# EAGLE design MODULE_TEST_usbHub_V_1_1_1sch (EAGLE 9.6.2)
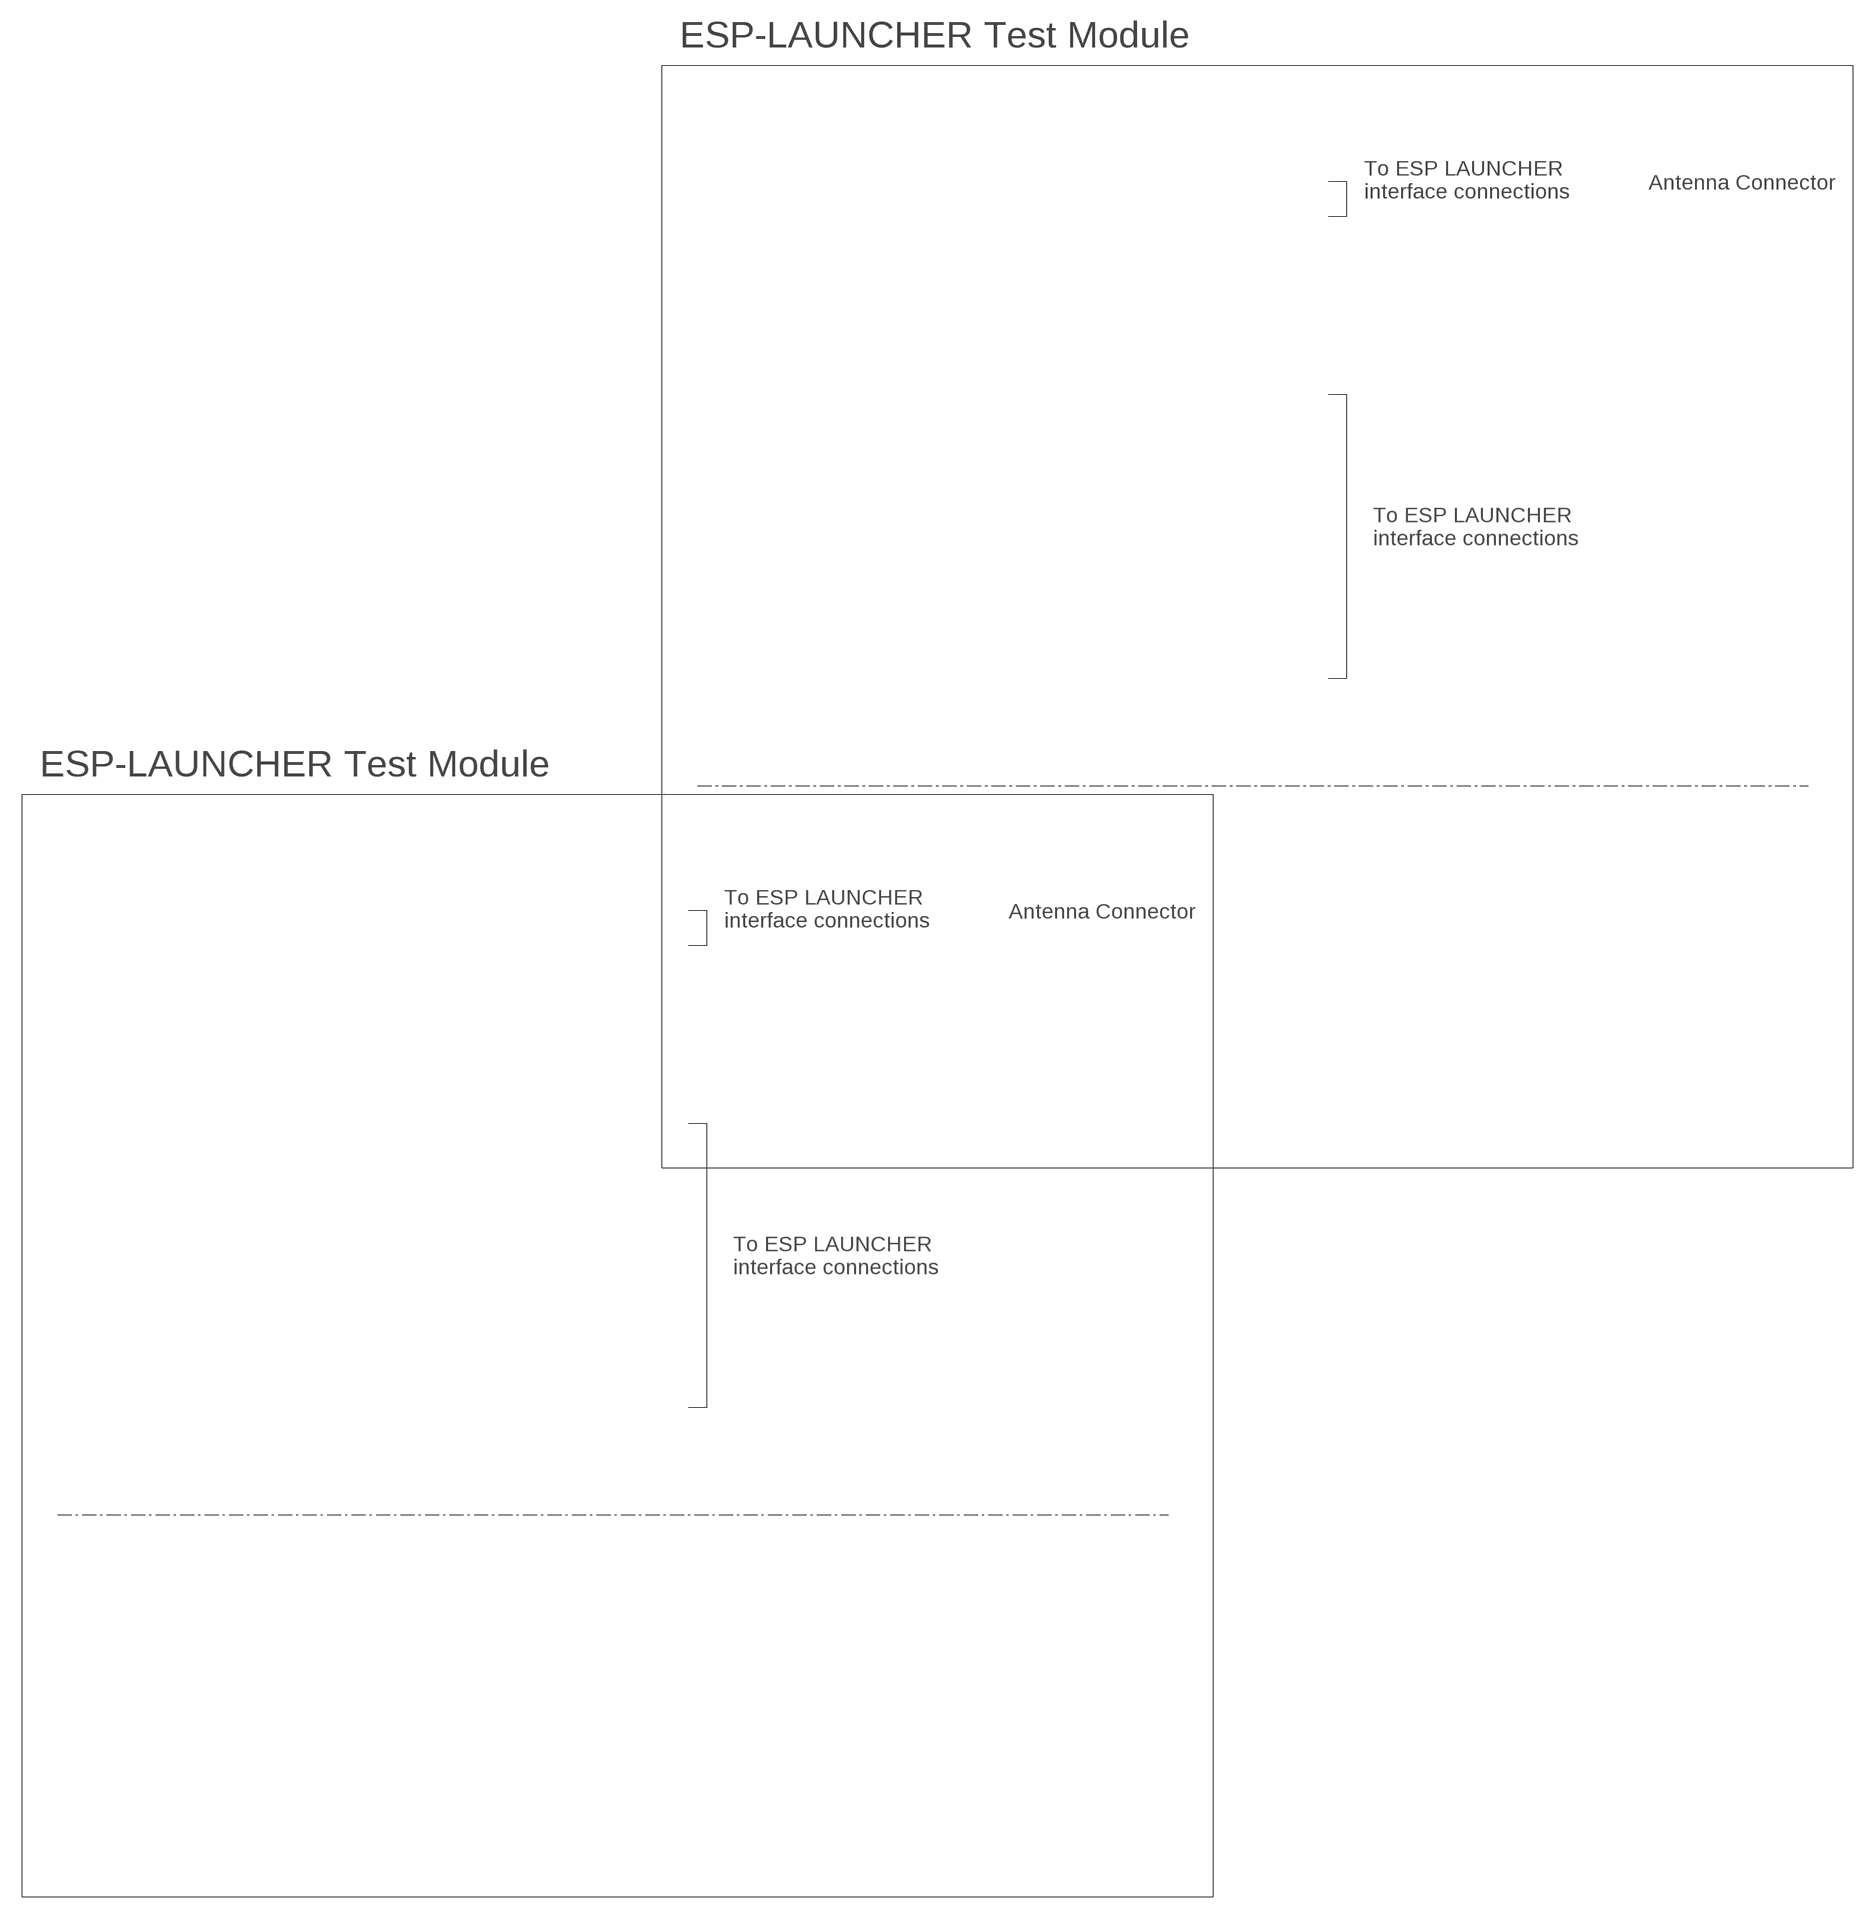
[diagram p0: schematic, sheet 1, part 1 of 3]
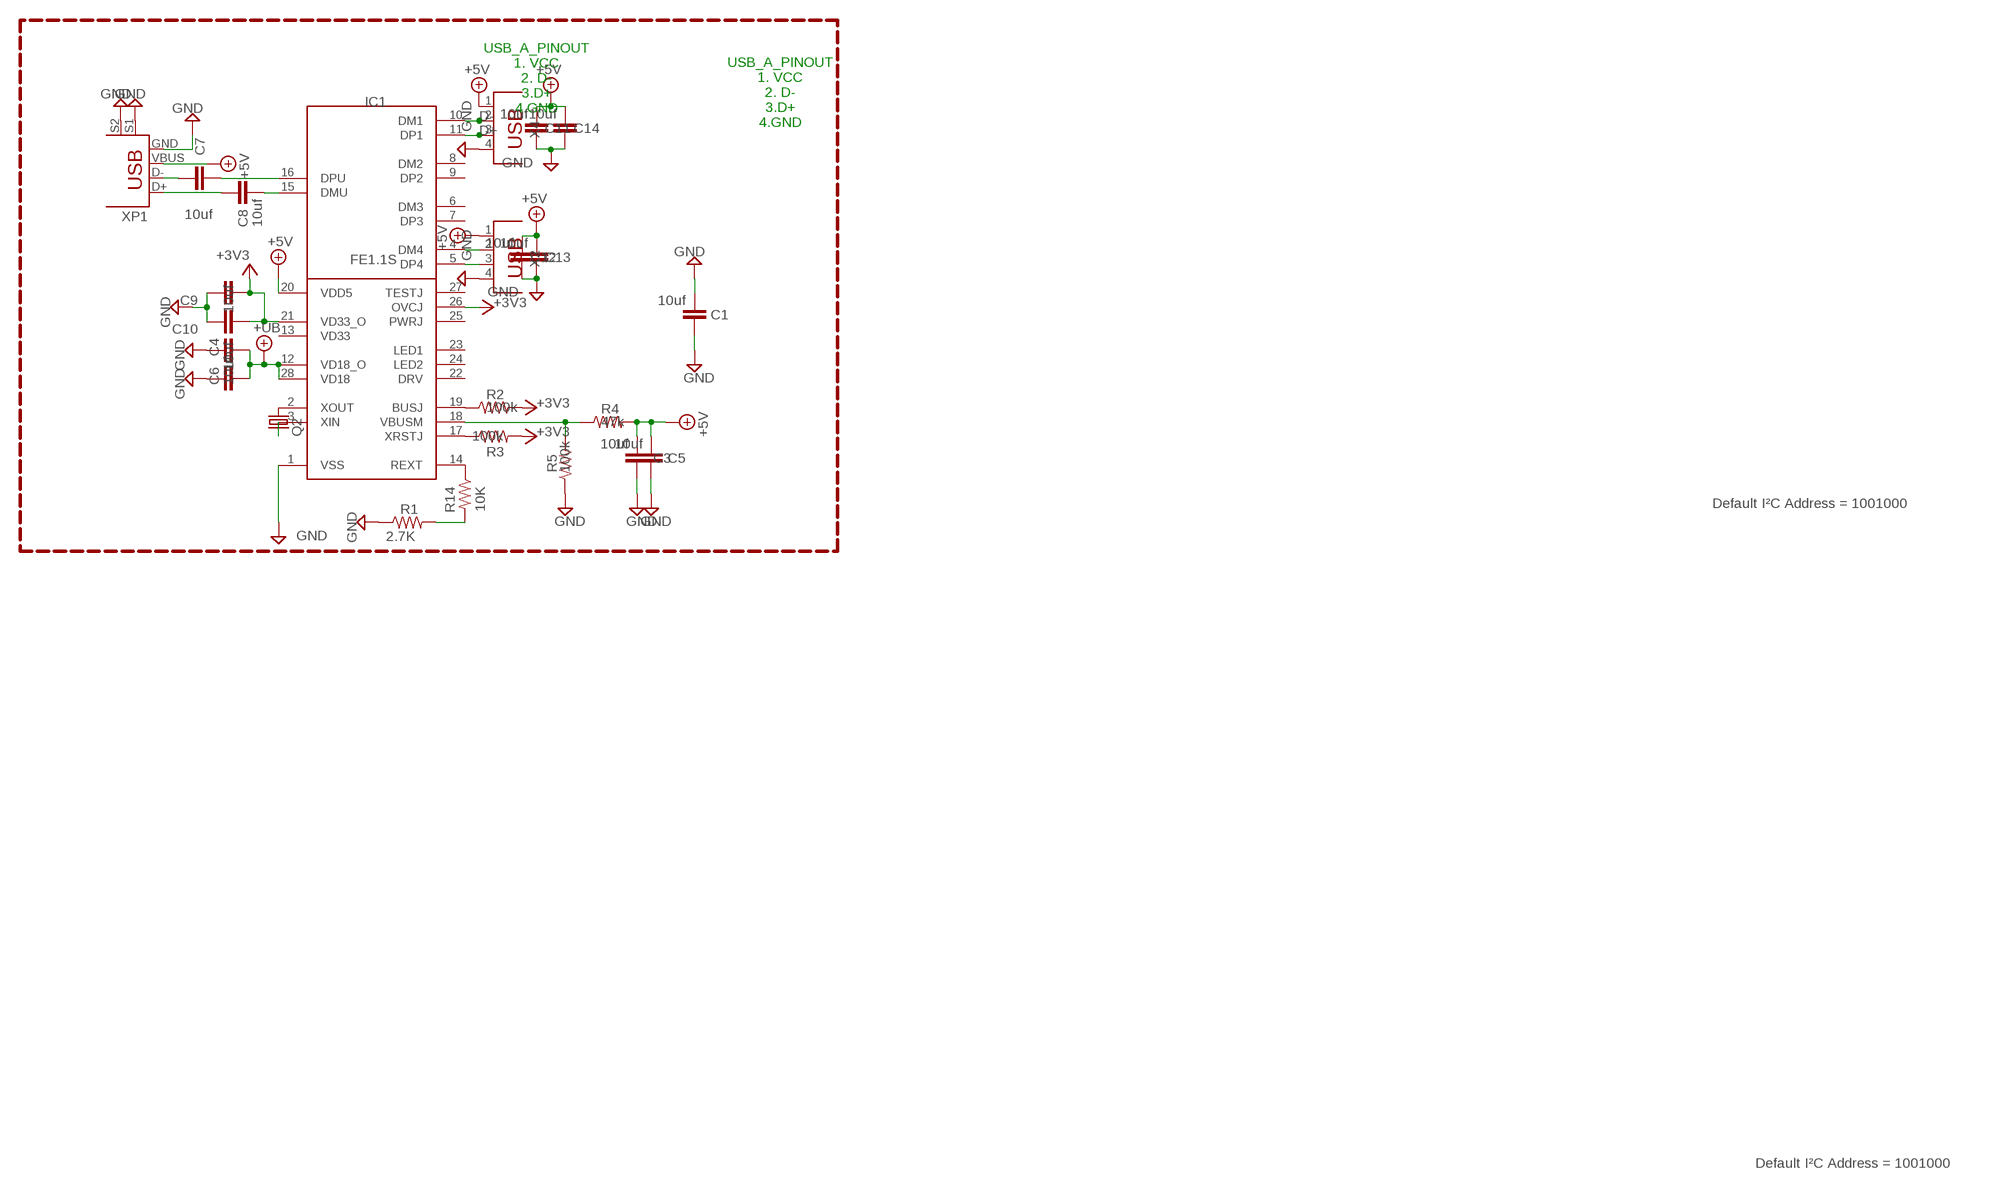
[diagram p1: schematic, sheet 1, part 2 of 3]
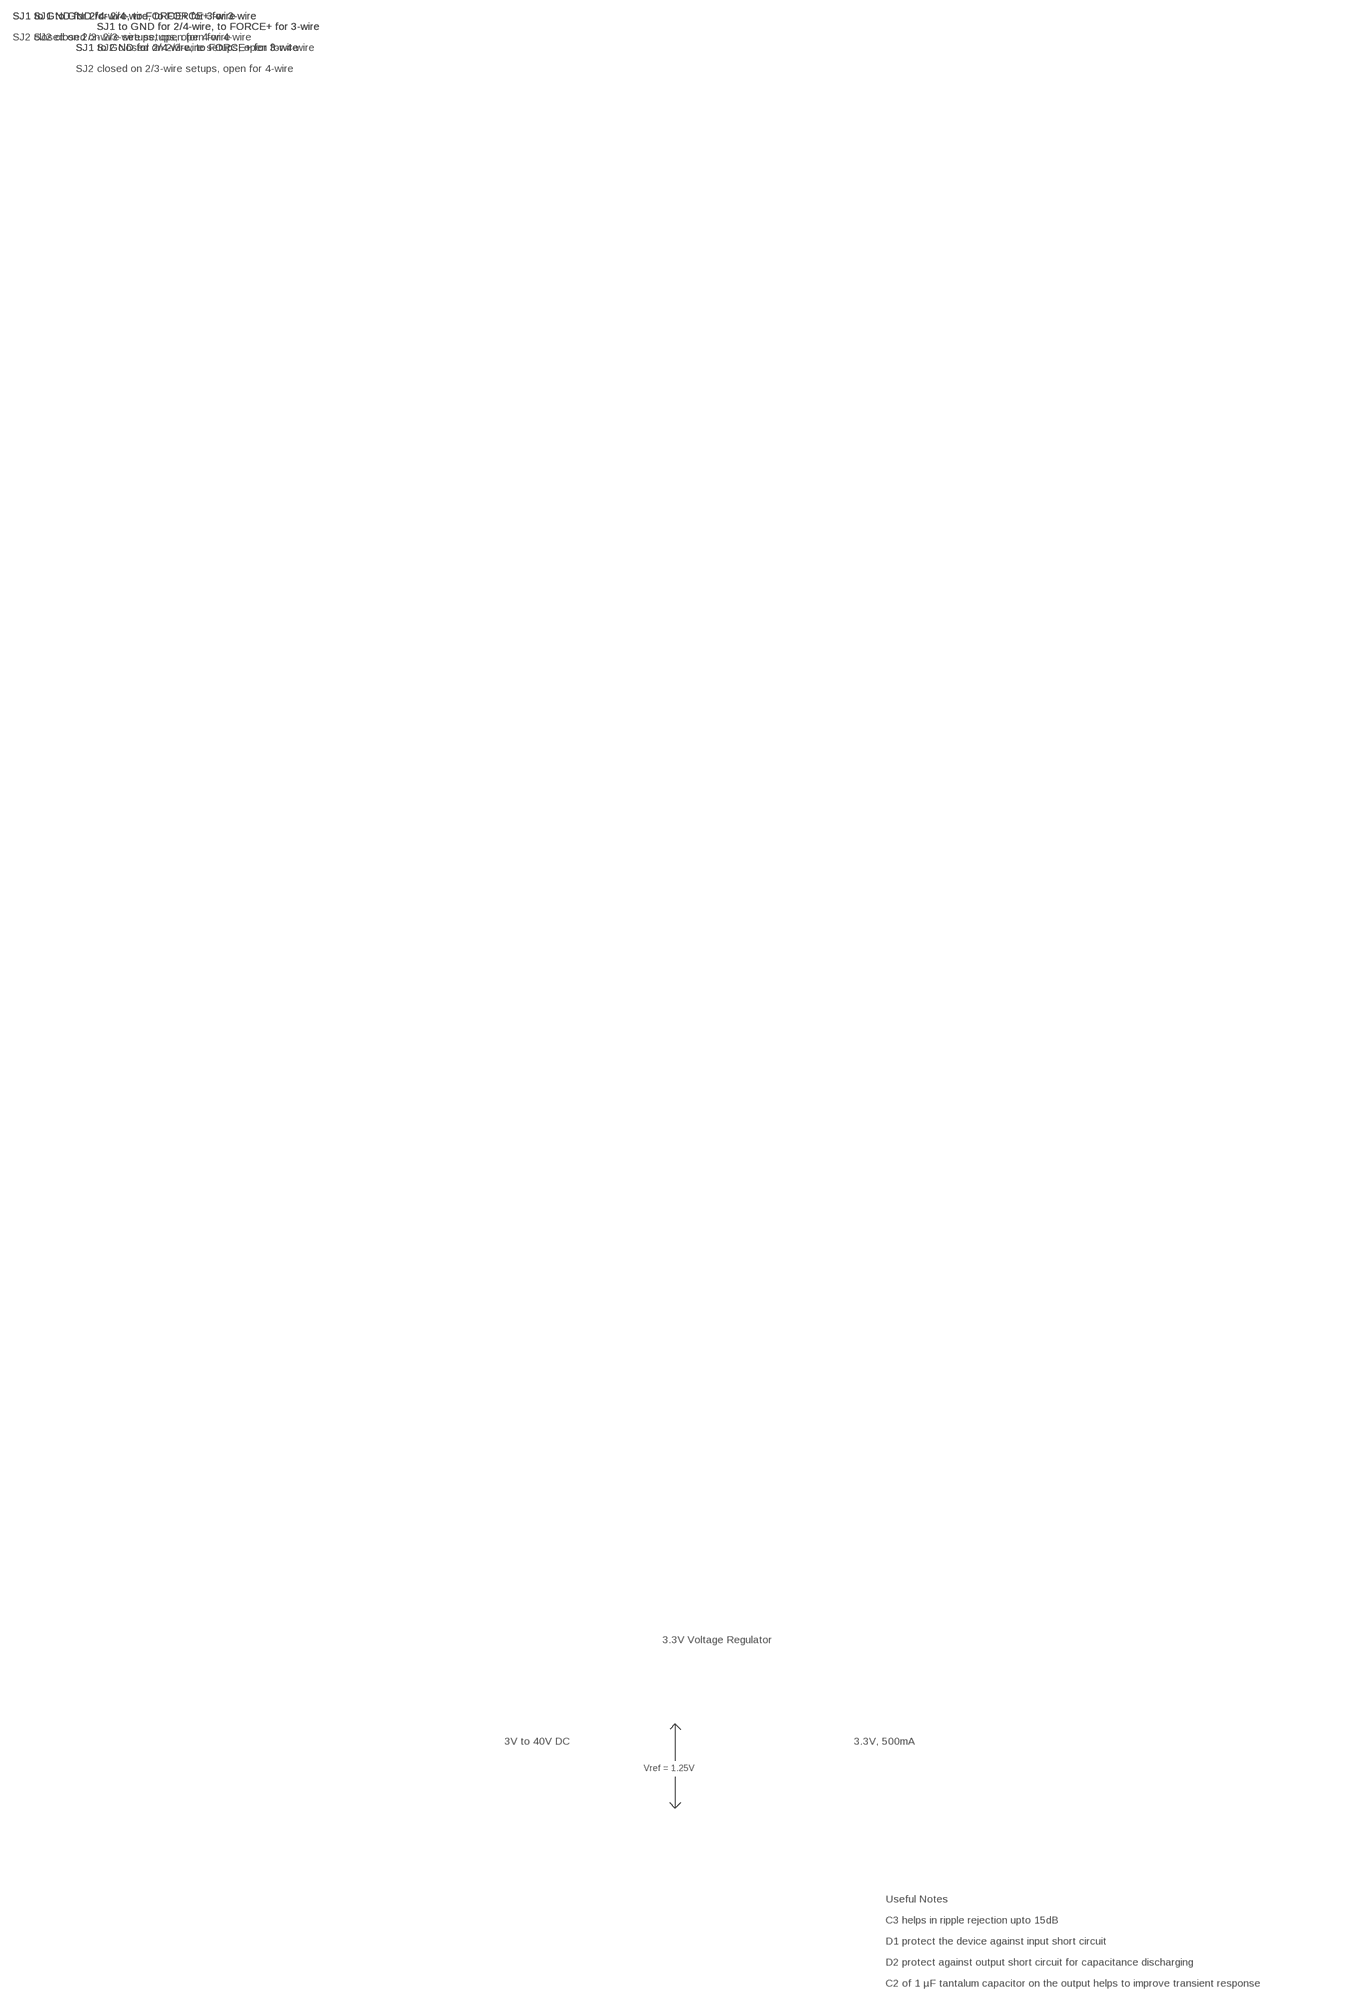
[diagram p2: schematic, sheet 1, part 3 of 3]

## Parts
C1  10uf  C-EUC1206K  [C1206K]
C3  10uf  C-EUC1206K  [C1206K]
C4  10uf  C-EUC0603  [C0603]
C5  10uf  C-EUC1206K  [C1206K]
C6  10uf  C-EUC0603  [C0603]
C7  10uf  C-EUC1206K  [C1206K]
C8  10uf  C-EUC1206K  [C1206K]
C9  10uf  C-EUC0603  [C0603]
C10  10uf  C-EUC0603  [C0603]
C11  10uf  C-EUC1206K  [C1206K]
C12  10uf  C-EUC1206K  [C1206K]
C13  10uf  C-EUC1206K  [C1206K]
C14  10uf  C-EUC1206K  [C1206K]
IC1  FE1.1S  [SOP64P600X175-28N]
Q2  CRYSTALSM49  [SM49]
R1  2.7K  R-US_R0603  [R0603]
R2  100k  R-US_R0603  [R0603]
R3  100k  R-US_R0603  [R0603]
R4  47k  R-US_R0603  [R0603]
R5  100k  R-US_R0603  [R0603]
R14  10K  R-US_R0603  [R0603]
X2  PN87520  [PN87520]
X4  PN87520  [PN87520]
XP1  USB+SHIELD  [USB-B-PTH]

## Nets
+3V3: C9.2 C10.2 IC1.21(VD33_O) IC1.26(OVCJ) R2.2 R3.2
+5V: C3.2 C5.2 C11.2 C12.2 C13.2 C14.2 IC1.20(VDD5) R4.2 X2.1 X4.1 XP1.VBUS
+UB: C4.2 C6.2 IC1.12(VD18_O) IC1.28(VD18)
D+: IC1.11(DP1) X4.3
D-: IC1.10(DM1) X4.2
GND: C1.1 C1.2 C3.1 C4.1 C5.1 C6.1 C9.1 C10.1 C11.1 C12.1 C13.1 C14.1 IC1.1(VSS) R1.1 R5.1 X2.4 X4.4 XP1.GND XP1.S1 XP1.S2
N$1: C8.1 XP1.D+
N$2: C8.2 IC1.15(DMU)
N$3: R1.2 R14.2
N$4: C7.1 XP1.D-
N$5: C7.2 IC1.16(DPU)
N$6: IC1.2(XOUT) Q2.2
N$7: IC1.19(BUSJ) R2.1
N$8: IC1.17(XRSTJ) R3.1
N$9: IC1.3(XIN) Q2.1
N$10: IC1.18(VBUSM) R4.1 R5.2
N$17: IC1.4(DM4) X2.2
N$25: IC1.14(REXT) R14.1
N$27: IC1.5(DP4) X2.3
Unconnected: IC1.6(DM3) IC1.7(DP3) IC1.8(DM2) IC1.9(DP2) IC1.13(VD33) IC1.22(DRV) IC1.23(LED1) IC1.24(LED2) IC1.25(PWRJ) IC1.27(TESTJ)

## Notes on the sheet
- ESP-LAUNCHER Test Module
- Antenna Connector
- To ESP LAUNCHER
  interface connections
- To ESP LAUNCHER
  interface connections
- ESP-LAUNCHER Test Module
- Antenna Connector
- To ESP LAUNCHER
  interface connections
- To ESP LAUNCHER
  interface connections
- USB_A_PINOUT
  1. VCC
  2. D-
  3.D+
  4.GND
- USB_A_PINOUT
  1. VCC
  2. D-
  3.D+
  4.GND
- Default I²C Address = 1001000
- Default I²C Address = 1001000
- SJ1 to GND for 2/4-wire, to FORCE+ for 3-wire | SJ1 to GND for 2/4-wire, to FORCE+ for 3-wire | SJ1 to GND for 2/4-wire, to FORCE+ for 3-wire | SJ1 to GND for 2/4-wire, to FORCE+ for 3-wire
- SJ1 to GND for 2/4-wire, to FORCE+ for 3-wire | SJ1 to GND for 2/4-wire, to FORCE+ for 3-wire
- SJ2 closed on 2/3-wire setups, open for 4-wire | SJ2 closed on 2/3-wire setups, open for 4-wire
- SJ1 to GND for 2/4-wire, to FORCE+ for 3-wire | SJ1 to GND for 2/4-wire, to FORCE+ for 3-wire | SJ2 closed on 2/3-wire setups, open for 4-wire
- SJ2 closed on 2/3-wire setups, open for 4-wire
- 3.3V Voltage Regulator
- 3V to 40V DC | 3.3V, 500mA
- Vref = 1.25V
- Useful Notes
- C3 helps in ripple rejection upto 15dB
- D1 protect the device against input short circuit
- D2 protect against output short circuit for capacitance discharging
- C2 of 1 µF tantalum capacitor on the output helps to improve transient response

## Library data of the parts
C1 C3-C14 = rcl:C-EU: CAPACITOR, European symbol; SPICEPREFIX: C
IC1 = FE1.1S:FE1.1S: Check availability <https://pricing.snapeda.com/parts/FE1.1S/terminus/view-part?ref=eda>; AVAILABILITY: In Stock; CHECK_PRICES: https://www.snapeda.com/parts/FE1.1S/Terminus/view-part/?ref=eda; DESCRIPTION: USB 2.0 HIGH SPEED 4-PORT HUB CONTROLLER; MF: terminus; MP: FE1.1S; PACKAGE: None; PRICE: None; SNAPEDA_LINK: https://www.snapeda.com/parts/FE1.1S/Terminus/view-part/?ref=snap
Q2 = adafruit:CRYSTAL: CRYSTAL; OC_FARNELL: unknown; OC_NEWARK: unknown
R1-R5 R14 = rcl:R-US_: RESISTOR, American symbol; SPICEPREFIX: R
X2 X4 = con-berg:PN87520: BERG USB connector; OC_FARNELL: unknown; OC_NEWARK: unknown
XP1 = barthess:USB+SHIELD: USB+Shield USB connector with shield pins connectable

## Module WAVESHAREDISPLAY
Ports: 

### Library data of the parts

## Board
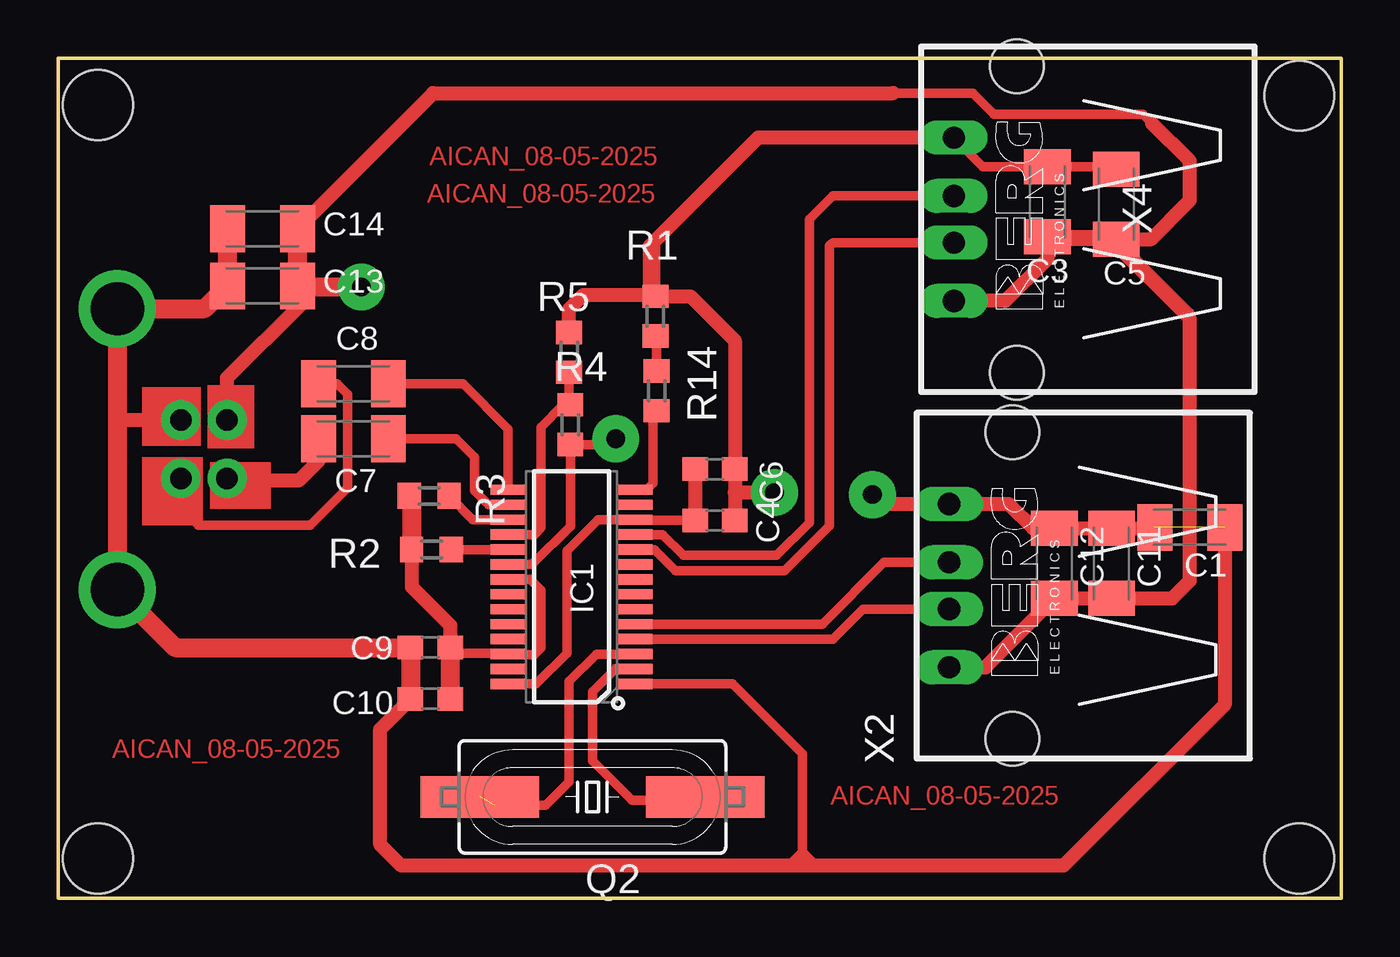
[diagram p3: board, top side]
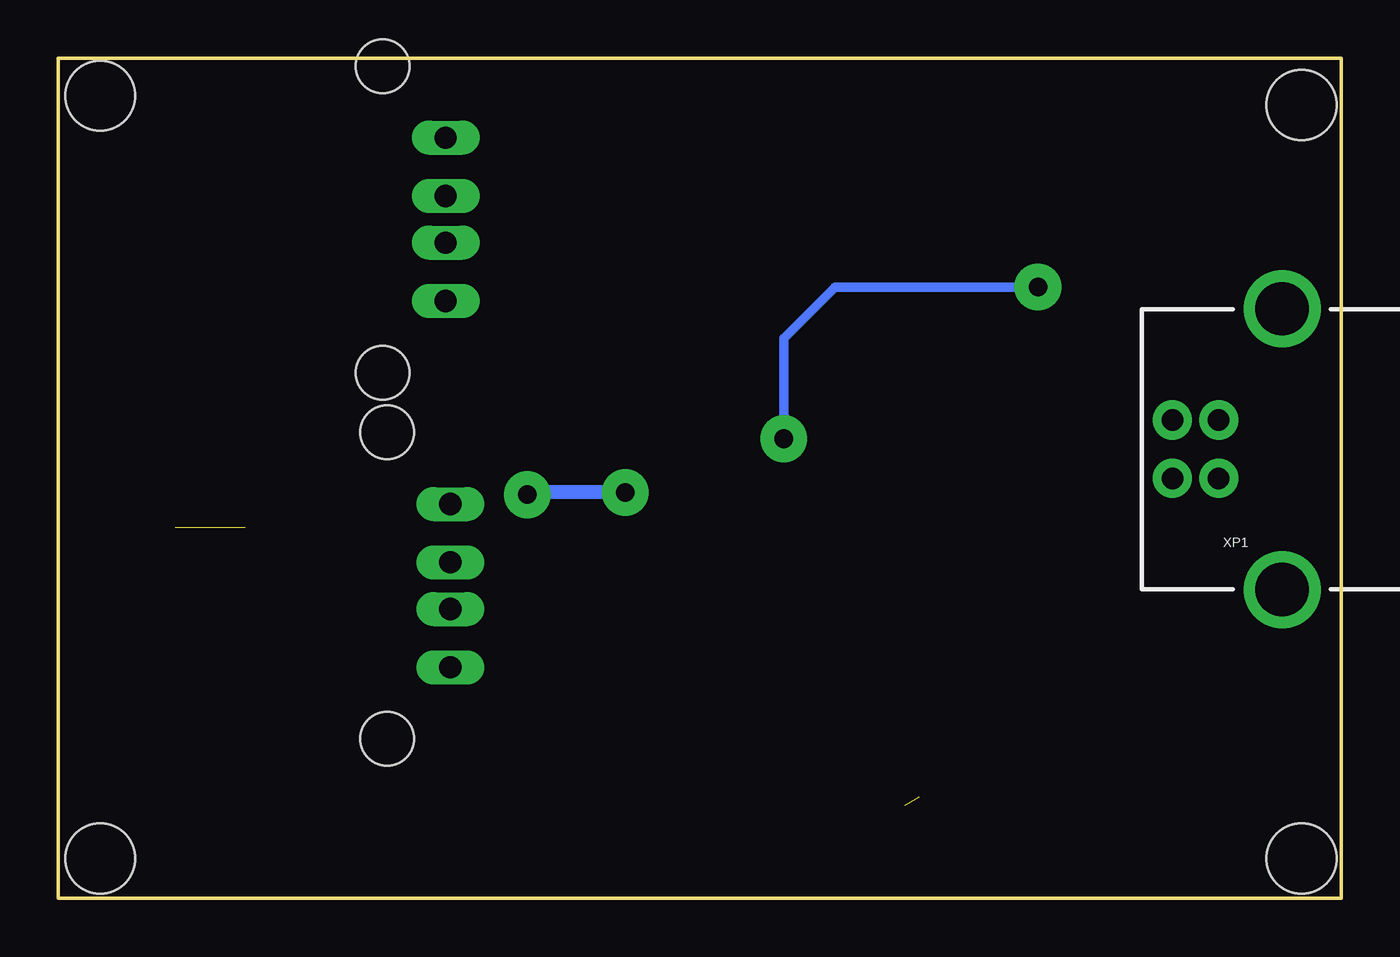
[diagram p4: board, bottom side, seen from below]

Size 55 x 36 mm. Coordinates in mm from the lower left corner, seen from the top.
Outline: 0,0 55,0 55,36 0,36 0,0
Copper layers (1*16): Top 0.035mm / dielectric 1.5mm / Bottom 0.035mm
Design rules "default": minimum track width 6mil, minimum drill 0.35mm, track to track 6mil, track to pad 6mil, pad to pad 6mil, via to via 6mil, smd to smd 6mil, copper to edge 40mil, drill to drill 6mil, minimum pad ring 10mil, minimum via ring 8mil, stop-mask expansion 4mil, vias tented up to drill 0mil, thermal gap 10mil
Holes 3 mm at 1.7,1.7 1.7,34 53.2,34.4 53.2,1.7

### Footprints (pad centres in the part's own frame; a part is rotated, then mirrored left to right if it is on the bottom)
C1206K = smd 1.5 x 2: 1 -1.5,0; 2 1.5,0
C0603 = smd 1.1 x 1: 1 -0.85,0; 2 0.85,0
SOP64P600X175-28N = smd 0.44 x 1.525: 1 -4.16,-2.712; 2 -3.52,-2.712; 3 -2.88,-2.712; 4 -2.24,-2.712; 5 -1.6,-2.712; 6 -0.96,-2.712; 7 -0.32,-2.712; 8 0.32,-2.712; 9 0.96,-2.712; 10 1.6,-2.712; 11 2.24,-2.712; 12 2.88,-2.712; 13 3.52,-2.712; 14 4.16,-2.712; 15 4.16,2.712; 16 3.52,2.712; 17 2.88,2.712; 18 2.24,2.712; 19 1.6,2.712; 20 0.96,2.712; 21 0.32,2.712; 22 -0.32,2.712; 23 -0.96,2.712; 24 -1.6,2.712; 25 -2.24,2.712; 26 -2.88,2.712; 27 -3.52,2.712; 28 -4.16,2.712
SM49 = smd 5.08 x 1.778: 1 -4.826,0; 2 4.826,0
R0603 = smd 1 x 1.1: 1 -0.85,0; 2 0.85,0
PN87520 = drill 0.95 long: 1 -3.5,2.71; 2 -1,2.71; 3 1,2.71; 4 3.5,2.71 | hole 2.3: -6.57,0; 6.57,0
USB-B-PTH = drill 0.914 pad 1.676: D+ 0,1.25; D- 1.981,1.25; GND 0,-1.25; VBUS 1.981,-1.25 | drill 2.286: S1 -2.718,-6.02; S2 -2.718,6.02

### Placement (x,y rotation side)
C1  48.5,15.9 180 top
C3  42.4,29.85 270 top
C4  28.15,16.2 180 top
C5  45.35,29.75 270 top
C6  28.15,18.4 180 top
C7  12.65,19.7 0 top
C8  12.65,22.05 0 top
C9  15.95,10.75 0 top
C10  15.95,8.55 0 top
C11  45.15,14.35 270 top
C12  42.7,14.35 270 top
C13  8.75,26.25 0 top
C14  8.75,28.7 0 top
IC1  22,13.35 90 top
Q2  22.9,4.35 0 top
R1  25.6,24.95 270 top
R2  16,14.95 180 top
R3  15.9,17.25 180 top
R4  21.95,20.3 270 top
R5  21.9,23.4 270 top
R14  25.65,21.75 90 top
X2  40.9,13.4 90 top
X4  41.1,29.1 90 top
XP1  5.25,19.25 180 bottom

### Tracks (layer width: path | path; a pad name or v marks a point on that pad's centre or on a via)
+3V3
  Top 0.406: C10.2 16.8,8.6 16.8,10.5 | 16.8,10.5 19.26,10.5 IC1.26 19.32,10.43 20.4,10.43 20.71,10.74 20.71,13.2 20.23,13.67 IC1.21 | C9.2 16.8,10.5
  Top 0.61: R2.2 15.15,13.35 16.8,11.7 16.8,10.5
  Top 0.813: R3.2 15.15,17.15 R2.2 | C9.2 16.8,8.6
+5V  (via drill 0.8 pad 2)
  Top 0.406: 18.76,14.31 IC1.20 20.31,14.31 21.95,15.95 R4.2 23.65,19.45 v23.9,19.7 | 35.8,34.51 39.21,34.51 40.12,33.6 46.5,33.6 46.9,33.2 | 48.5,29.9 48.4,29.8 | 46.85,28.25 45.6,28.25 C5.2 | C5.2 45.1,28.25 42.5,28.25 | C5.2 48.5,25.1 48.5,13.6 | 10.4,26.1 10.3,26.2
  Top 0.61: 45.1,28.25 48.5,24.85 48.5,13.6 47.75,12.85 C11.2 C12.2 39.75,9.9 X2.1 | C3.2 42.5,28.25 C5.2 46.85,28.25 48.4,29.8 | C3.2 42.4,27.4 40.6,25.6 X4.1 | C3.2 45.5,28.35 45.6,28.25 | 48.5,29.9 48.5,31.6 46.9,33.2 | C14.2 16.06,34.51 35.8,34.51 | XP1.VBUS 7.23,22.3 10.4,25.47 10.4,26.1
  Top 0.813: v13,26.2 10.3,26.2 C13.2 C14.2
  Bottom 0.406: v23.9,19.7 23.9,24 21.7,26.2 v13,26.2
+UB
  Top 0.406: C4.2 24.74,16.2 IC1.12 23.13,16.23 21.8,14.9 21.8,10.5 20.49,9.19 IC1.28
  Top 0.61: C6.2 C4.2
D+
  Top 0.406: IC1.11 25.91,15.59 26.8,14.7 30.8,14.7 32.2,16.1 32.2,29.1 33.2,30.1 X4.3
D-
  Top 0.406: X4.2 33.2,28.1 33.06,27.96 33.06,15.97 31.13,14.04 26.47,14.04 25.56,14.95 IC1.10
GND  (via drill 0.8 pad 2)  (1 unrouted)
  Top 0.406: 15.1,8.7 C10.1 | C4.1 29,16.5 | 29,16.5 29,17.4 | 29.1,16.5 29,16.5 | 7.25,28.05 7.4,28.2 7.4,28.55 C14.1 | X4.4 39.64,31.35 C3.1 45.25,31.35 C5.1 | 25.6,28.2 R1.1 | C12.1 41.8,15.85 | IC1.1 28.91,9.19 31.9,6.2 31.9,2 | 31.9,1.4 31.9,2 | 31.9,2 31.3,1.4 31.2,1.4 | 31.9,2 32.5,1.4
  Top 0.61: 29,17.4 C6.1 29,23.9 27.1,25.8 R1.1 25.35,26.05 | 29,17.4 C4.1 | 29,17.4 v30.7,17.4 | v34.9,17.3 35.3,16.9 X2.4 40.75,16.9 41.8,15.85 | C12.1 C11.1 46.95,15.85 C1.2 | X4.4 30,32.6 25.6,28.2 25.35,27.95 25.35,25.85 22.5,25.85 21.9,25.25 R5.1 | XP1.GND 2.53,20.5 | C1.1 50,8.3 43.1,1.4 32.5,1.4 31.9,1.4 31.2,1.4 14.7,1.4 13.8,2.3 13.8,7.25 C10.1
  Top 0.813: C14.1 C13.1 6.27,25.27 XP1.S1 2.53,20.5 XP1.S2 5.01,10.75 C9.1 15.1,8.7
  Bottom 0.61: v30.7,17.4 34.8,17.4 v34.9,17.3
N$1
  Top 0.406: XP1.D+ 5.25,16.75 6,16 10.8,16 12.4,17.6 12.4,21.6 11.95,22.05 C8.1
N$2
  Top 0.406: C8.2 17.35,22.05 19.29,20.11 IC1.15
N$3
  Top 0.406: R1.2 25.65,24.05 R14.2
N$4
  Top 0.61: C7.1 11.15,18.75 10.3,17.9 7.33,17.9 XP1.D-
N$5
  Top 0.406: IC1.16 18.44,16.87 17.85,17.46 17.85,18.9 17.05,19.7 C7.2
N$6
  Top 0.406: IC1.2 24.68,9.87 23.9,9.87 22.9,8.86 22.9,5.9 24.6,4.2 27.58,4.2 Q2.2
N$7
  Top 0.406: R2.1 IC1.19
N$8
  Top 0.406: R3.1 17.77,16.23 IC1.17
N$9  (1 unrouted)
  Top 0.406: IC1.3 23.07,10.47 21.9,9.3 21.9,5 20.9,4 18.7,4
N$10
  Top 0.406: IC1.18 20.39,15.59 20.7,15.9 20.7,20.2 21.65,21.15 R4.1 21.9,21.2 R5.2
N$17
  Top 0.406: X2.2 34.5,12.4 33.21,11.11 IC1.4
N$25
  Top 0.406: R14.1 25.5,20.75 25.5,17.8 25.21,17.51 IC1.14
N$27
  Top 0.406: IC1.5 32.75,11.75 35.4,14.4 X2.3
(copper drawn outside any net)
  shapes: Top area x5

### Text on the board
Top: AICAN_08-05-2025 | AICAN_08-05-2025 | AICAN_08-05-2025 | AICAN_08-05-2025